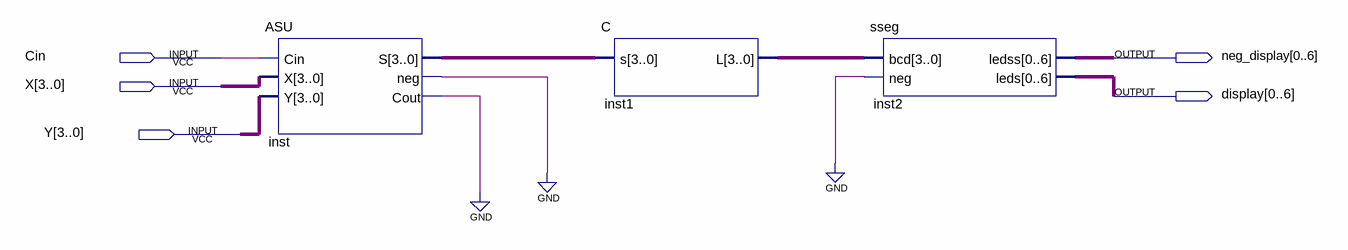
[diagram p0: schematic sheet]
// Quartus schematic CombinedASU2.bdf as structural Verilog: 3 symbols, 5 pins
module CombinedASU2 (
  input  Cin,
  input  [3:0] X,
  input  [3:0] Y,
  output [0:6] neg_display,
  output [0:6] display
);

  wire inst_cout, inst_neg;
  wire [3:0] inst1_l, inst_s;

  ASU inst (.Cin(Cin), .X(X), .Y(Y), .S(inst_s), .neg(inst_neg), .Cout(inst_cout));
  C inst1 (.s(inst_s), .L(inst1_l));
  sseg inst2 (.bcd(inst1_l), .neg(1'b0), .ledss(neg_display), .leds(display));
  // also tied to GND on the sheet: {inst_cout, inst_neg}
endmodule
